# Altium schematic sheet Comunicaciones.SchDoc
size A4; SheetNumber: 2; SheetTotal: 3
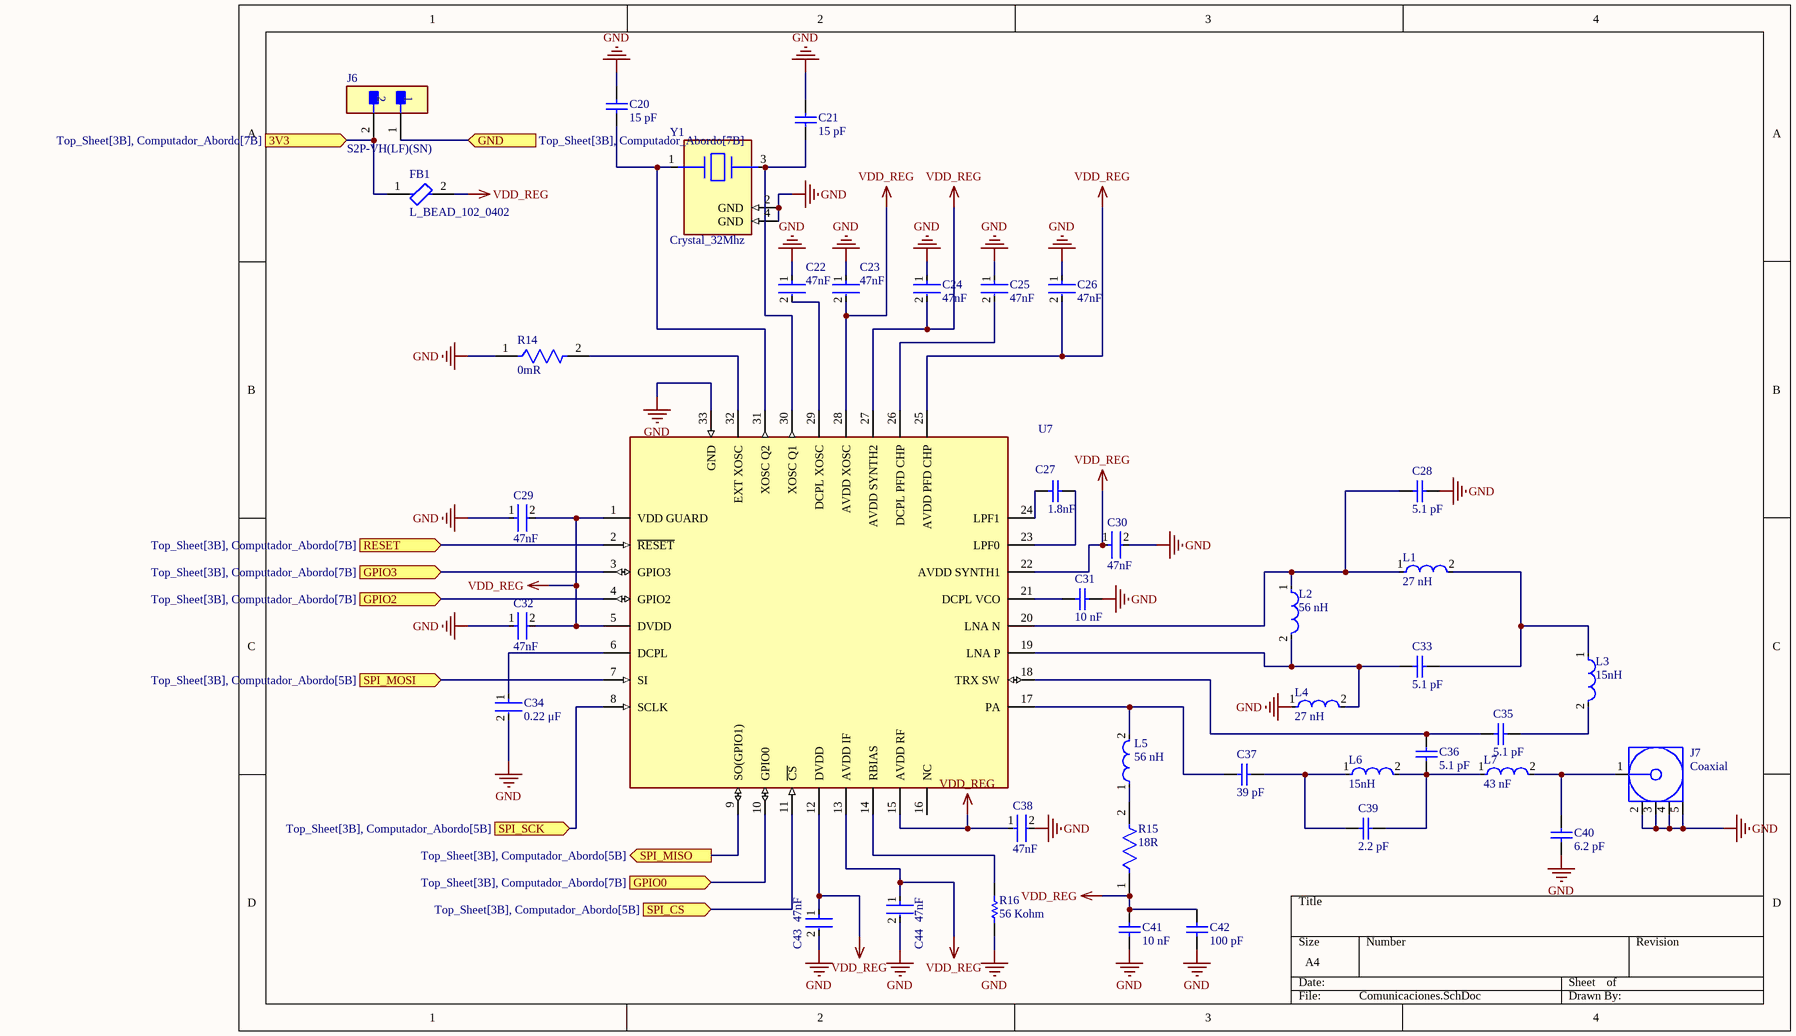
[diagram p0: Comunicaciones.SchDoc]

## Parts
C20  15 pF  [CAPC1005X55X25LL05T10]
C21  15 pF  [CAPC1005X55X25LL05T10]
C22  47nF  [FP-GRM155-0_05-IPC_A]
C23  47nF  [FP-GRM155-0_05-IPC_A]
C24  47nF  [FP-GRM155-0_05-IPC_A]
C25  47nF  [FP-GRM155-0_05-IPC_A]
C26  47nF  [FP-GRM155-0_05-IPC_A]
C27  1.8nF  [CAPC1005X55X25LL05T10]
C28  5.1 pF  [CAPC1005X55X25LL05T10]
C29  47nF  [FP-GRM155-0_05-IPC_A]
C30  47nF  [FP-GRM155-0_05-IPC_A]
C31  10 nF  [CAPC1005X55X25LL05T10]
C32  47nF  [FP-GRM155-0_05-IPC_A]
C33  5.1 pF  [CAPC1005X55X25LL05T10]
C34  0.22 μF  [FP-C0603C-CF-IPC_B]
C35  5.1 pF  [CAPC1005X55X25LL05T10]
C36  5.1 pF  [CAPC1005X55X25LL05T10]
C37  39 pF  [CAPC1005X55X25LL05T10]
C38  47nF  [FP-GRM155-0_05-IPC_A]
C39  2.2 pF  [CAPC1005X55X25LL05T10]
C40  6.2 pF  [CAPC1005X60X25ML10T15]
C41  10 nF  [CAPC1005X55X25LL05T10]
C42  100 pF  [CAPC1005X55X25LL05T10]
C43  47nF  [FP-GRM155-0_05-IPC_A]
C44  47nF  [FP-GRM155-0_05-IPC_A]
FB1  L_BEAD_102_0402  [FP-BLM15-0_05-IPC_C]
J6  S2P-VH(LF)(SN)  [FP-S2P-VH_LF_SN-MFG]
J7  Coaxial  [60312202114512]
L1  27 nH  [FP-LQW15AN_00-W0_5-0_1-MFG]
L2  56 nH  [FP-LQW15AN_00-W0_5-0_1-MFG]
L3  15nH  [FP-LQW15AN_00-W0_6-0_1-MFG]
L4  27 nH  [FP-LQW15AN_00-W0_5-0_1-MFG]
L5  56 nH  [FP-LQW15AN_00-W0_5-0_1-MFG]
L6  15nH  [FP-LQW15AN_00-W0_6-0_1-MFG]
L7  43 nF  [FP-LQW15AN_00-W0_5-0_1-MFG]
R14  0mR  [FP-RK73Z1E-IPC_B]
R15  18R  [FP-RMCF0402-IPC_B]
R16  56 Kohm  [RESC1005X40X25ML10T10]
U7  (no value)  [FP-RHB0032E-MFG]
Y1  Crystal_32Mhz  [FP-ABM10W-MFG]

## Ports
3V3 (in, see Top_Sheet[3B], Computador_Abordo[7B]), GND (in, see Top_Sheet[3B], Computador_Abordo[7B]), GPIO0 (in, see Top_Sheet[3B], Computador_Abordo[7B]), GPIO2 (in, see Top_Sheet[3B], Computador_Abordo[7B]), GPIO3 (in, see Top_Sheet[3B], Computador_Abordo[7B]), RESET (in, see Top_Sheet[3B], Computador_Abordo[7B]), SPI_CS (in, see Top_Sheet[3B], Computador_Abordo[5B]), SPI_MISO (out, see Top_Sheet[3B], Computador_Abordo[5B]), SPI_MOSI (in, see Top_Sheet[3B], Computador_Abordo[5B]), SPI_SCK (in, see Top_Sheet[3B], Computador_Abordo[5B])

## Nets
GND: C20.2 C21.2 C22.1 C23.1 C24.1 C25.1 C26.1 C28.1 C29.1 C30.2 C31.2 C32.1 C34.2 C38.2 C40.1 C41.1 C42.2 C43.2 C44.2 J7.2(GND) J7.3(GND) J7.4(GND) J7.5(GND) L4.1 R14.1 R16.1 U7.33(GND) Y1.2(GND) Y1.4(GND)
VDD_REG: C23.2 C24.2 C26.2 C29.2 C30.1 C32.2 C38.1 C41.2 C42.1 C43.1 C44.1 FB1.2 R15.1 U7.1(VDD_GUARD) U7.5(DVDD) U7.12(DVDD) U7.13(AVDD_IF) U7.15(AVDD_RF) U7.22(AVDD_SYNTH1) U7.25(AVDD_PFD_CHP) U7.27(AVDD_SYNTH2) U7.28(AVDD_XOSC)
3V3: FB1.1 J6.2 ; port 3V3
GND: J6.1 ; port GND  [a separate net that carries the same name]
GPIO0: U7.10(GPIO0) ; port GPIO0
GPIO2: U7.4(GPIO2) ; port GPIO2
GPIO3: U7.3(GPIO3) ; port GPIO3
RESET: U7.2(~{RESET}) ; port RESET
SPI_CS: U7.11(~{CS}) ; port SPI_CS
SPI_MISO: U7.9(SO(GPIO1)) ; port SPI_MISO
SPI_MOSI: U7.7(SI) ; port SPI_MOSI
SPI_SCK: U7.8(SCLK) ; port SPI_SCK
NetC20_1: C20.1 U7.31(XOSC_Q2) Y1.1
NetC21_1: C21.1 U7.30(XOSC_Q1) Y1.3
NetC22_2: C22.2 U7.29(DCPL_XOSC)
NetC25_2: C25.2 U7.26(DCPL_PFD_CHP)
NetC27_1: C27.1 U7.23(LPF0)
NetC27_2: C27.2 U7.24(LPF1)
NetC28_2: C28.2 L1.1 L2.1 U7.20(LNA_N)
NetC31_1: C31.1 U7.21(DCPL_VCO)
NetC33_1: C33.1 L1.2 L3.1
NetC33_2: C33.2 L2.2 L4.2 U7.19(LNA_P)
NetC34_1: C34.1 U7.6(DCPL)
NetC35_1: C35.1 L3.2
NetC35_2: C35.2 C36.1 U7.18(TRX_SW)
NetC36_2: C36.2 C39.2 L6.2 L7.1
NetC37_1: C37.1 L5.2 U7.17(PA)
NetC37_2: C37.2 C39.1 L6.1
NetC40_2: C40.2 J7.1(Signal) L7.2
NetL5_1: L5.1 R15.2
NetR14_2: R14.2 U7.32(EXT_XOSC)
NetR16_2: R16.2 U7.14(RBIAS)

Not connected (* = marked no-connect by the designer): U7 16(NC)

## Library data of the parts
C20 C21 = C_15P_0402_NP0_J_50: Part Number: GRM1555C1H150JZ01D; Manufacturer: Murata; Value: 15 pF
C22-C26 C29 C30 C32 C38 C43 C44 = C_47N_0402_X7R_K_25: Chip Multilayer Ceramic Capacitors for General Purpose, 0402, 47000pF, X7R, 15%, 10%, 25V; Depth: 0.5mm; Capacitance: 47nF; Case/Package: 0402; Tolerance: 10%; REACH SVHC: No SVHC; Termination: SMD/SMT; Number of Pins: 2; Mount: Surface Mount; Radiation Hardening: No; Height: 0.5mm; Min Operating Temperature: -55°C; Max Operating Temperature: 125°C; Thickness: 0.022inch; Length: 1mm; Voltage Rating (DC): 25V; Material: Ceramic; Lead Free: Lead Free; Packaging: Tape and Reel; Dielectric: X7R; Voltage: 25V; Case Code (Metric): 1005; Width: 0.02inch; Case Code (Imperial): 0402; Voltage Rating: 25V; Package Quantity: 1
C27 = C_1N8_0402_U2J_J_10: GRM1557U1A182JA01D; Manufacturer: Murata; Part Number: GRM1557U1A182JA01D; Value: 1.8nF
C28 C33 C35 C36 = C_5P1_0402_NP0_C_50: Part Number: GRM1555C1H5R1CZ01D; Manufacturer: Murata; Value: 5.1 pF
C31 C41 = C_10N_0402_X7R_K_25: Manufacturer: Murata; Part Number: GRM155R71E103KA01D; Value: 10 nF
C34 = C_220N_0402_X5R_K_10: C0603 0.22 μF X7R 30ppm/°C 10.00% 10 V; Manufacturer Part Number: C0603C224K8RAC; Manufacturer: KEMET; Automotive Grade: Grade 1; Material: Ceramic; Voltage Rating: 10 V; Tolerance: 0.1; Capacitance: 0.22 μF; Device Class L2: Capacitors; Temperature Range High: +125°C; RoHS: TRUE; Device Class L1: Passive Components; Temperature: -55°C to +125°C; Temperature Coefficient: 30ppm/°C; ComponentLink2Description: Datasheet; Device Class L3: Ceramic Capacitors; ComponentLink2URL: https://api.kemet.com/component-edge/download/datasheet/C0603C100J5GACAUTO.pdf; Value: 0.22 μF; Category: Cap; Lead Free: Yes; Automotive: Yes; Height: 0.87mm; Temperature Characteristic: X7R; Mouser Description: Multilayer Ceramic Capacitors MLCC - SMD/SMT 50volts 0.22 uF C0G X7R; Octopart: https://octopart.com/c0603c224k8rac-kemet-7455784; Package: C0603C-CF; Temperature Range Low: -55°C
C37 = C_39P_0402_NP0_J_50: Chip Capacitor, 39 pF, +/- 5%, 50 V, -55 to 125 degC, 0402 (1005 Metric), RoHS, Tape and Reel; PartNumber: GRM1555C1H390JZ01D; Voltage Rating (DC): 50 V; Type (Capacitors): C0G; Case\/Package: 0402; Length: 0.039 inch; RoHSCompliant: true; ComponentLink1URL: http://www.murata.com/; Packaging: Tape and Reel; Lead Pitch: 2 mm; PackageDescription: 2-Pin Surface Mount Device, Body 1 x 0.5 mm; PackageReference: 0402; Case Code (Metric): 1005; Pins: 2; Capacitance: 39 pF; Mounting Technology: Surface Mount; DatasheetVersion: 09/2016; REACH SVHC: No SVHC; Radiation Hardening: No; ComponentLink2Description: Datasheet; ComponentLink1Description: Manufacturer URL; Height: 0.5 mm; Package Quantity: 10000; Case Code (Imperial): 0402; Width: 0.02 inch; ComponentLink2URL: http://psearch.en.murata.com/capacitor/product/GRM1555C1H390JZ01_.pdf; Voltage Rating: 50 V; Max Operating Temperature: 125 degC; Min Operating Temperature: -55 degC; Mount: Surface Mount; Tolerance: 5%
C39 = C_2P2_0402_NP0_C_50: Manufacturer: Murata; Part Number: GRM1555C1H2R2CZ01D; Value: *
C40 = C_6P2_0402_NP0_C_50: Manufacturer: AVX Interconnect / Elco; Part Number: 04025A6R2CAT2A; Value: 6.2 pF
C42 = C_100P_0402_NP0_J_50: Part Number: GRM1555C1H101JZ01D; Manufacturer: Murata; Value: 100 pF
FB1 = L_BEAD_102_0402: Chip Ferrite Bead, 0402, 1000Ω @ 100MHz, 1.1Ω, 25%, 250mA; Number of Circuits: 1; DC Resistance-Max: 1.1R; Impedance: 1kR; Material: Steel; Shielding: Unshielded; Number of Pins: 2; REACH SVHC: No SVHC; Case/Package: 0402; Core Material: Ferrite; Packaging: Tape and Reel; Max DC Current: 250mA; Test Frequency: 100MHz; Case Code (Metric): 1005; Height: 0.5mm; Military Standard: Not; Max Operating Temperature: 125°C; Termination: SMD/SMT; Tolerance: 25%; Length: 1mm; Number of Lines: 1; Min Operating Temperature: -55°C; Depth: 0.5mm; Case Code (Imperial): 0402; DC Current: 250mA; Contact Plating: Tin; Series: BLM15H; Radiation Hardening: No; Width: 0.5mm; DC Resistance (DCR): 1.1R; Max Current Rating: 250mA; Current Rating: 250mA; Package Quantity: 1; Lead Free: Lead Free; Frequency: 100MHz
J6 = CMP-17439-000358-1: CONN HEADER R/A 2POS 3.96MM; Max Current Rating: 10A; Max Voltage Rating (AC): 250V; Contact Resistance: 20mR; Number of Positions: 2; Housing Color: White; Packaging: Box; Termination: Solder; Number of Rows: 1; Length: 7.86mm; Orientation: Right Angle; Pitch: 3.96mm; Min Operating Temperature: -25°C; Contact Plating: Copper; Max Operating Temperature: 85°C; Lead Free: Lead Free; Housing Material: Polyamide; Contact Material: Brass
J7 = SMA-10V21-TGG: Rf Coax Conn, Sma Jack, 50 Ohm, Pcb Rohs Compliant: Yes |Wurth Elektronik 60312202114512; Impedance: 50Ω; Insulation Resistance: 5GΩ; Insertion Loss (dB): 0.14dB; Min Operating Temperature: -65°C; Max Operating Temperature: 165°C; Orientation: Straight; Connector Type: SMA; Insulation Material: PTFE
L1 L4 = L_27N_0402_J_LQW: Wire Wound RF Inductor 27nH ±5% 280mA 0.52Ω 0402 (1005); Test Frequency: 100MHz; DC Resistance (DCR): 520mR; Q Factor: 25; Self Resonant Frequency: 3.5GHz; Core Material: Air; Shielding: Unshielded; Mount: Surface Mount; Package Quantity: 10000; Max Operating Temperature: 125°C; Termination: SMD/SMT; Weight: 2.8E-05oz; Case Code (Metric): 1005; Radiation Hardening: No; Case Code (Imperial): 0402; Military Standard: Not; Packaging: Tape and Reel; Tolerance: 5%; Lead Free: Lead Free; Depth: 0.6mm; DC Current: 280mA; Inductance: 27nH; Current Rating: 280mA; Min Operating Temperature: -55°C; Width: 0.02inch; Height: 0.5mm; Length: 1mm; Max DC Current: 280mA; Case/Package: 0402; Resistor Type: Wirewound; Value: 27 nH
L2 L5 = L_56N_0402_J_LQW: Wire Wound RF Inductor 56nH ±5% 200mA 1.17Ω 0402 (1005); Test Frequency: 100MHz; Shielding: Unshielded; Self Resonant Frequency: 2.8GHz; Core Material: Air; Q Factor: 25; DC Resistance (DCR): 1.17R; Termination: SMD/SMT; Case Code (Imperial): 0402; Resistor Type: Wirewound; Mount: Surface Mount; Tolerance: 5%; Lead Free: Lead Free; Height: 0.5mm; Packaging: Tape and Reel; Min Operating Temperature: -55°C; Max DC Current: 200mA; Case/Package: 0402; Package Quantity: 10000; Military Standard: Not; Current Rating: 200mA; DC Current: 200mA; Inductance: 56nH; Depth: 0.6mm; Radiation Hardening: No; Case Code (Metric): 1005; Max Operating Temperature: 125°C; Length: 1mm; Weight: 2.8E-05oz; Width: 0.5mm; =Value: 56 nH
L3 L6 = L_15N_0402_J_LQW: Wire Wound RF Inductor 15nH ±5% 460mA 0.16Ω 0402 (1005); Test Frequency: 100MHz; DC Resistance (DCR): 160mR; Shielding: Unshielded; Q Factor: 30; Core Material: Air; Self Resonant Frequency: 5GHz; Resistor Type: Wirewound; DC Current: 460mA; Inductance: 15nH; Weight: 2.8E-05oz; Radiation Hardening: No; Depth: 0.7mm; Package Quantity: 10000; Case/Package: 0402; Packaging: Tape and Reel; Length: 1mm; Max DC Current: 460mA; Case Code (Imperial): 0402; Tolerance: 5%; Min Operating Temperature: -55°C; Lead Free: Lead Free; Width: 0.02inch; Case Code (Metric): 1005; Termination: SMD/SMT; Military Standard: Not; Current Rating: 460mA; Height: 0.5mm; Mount: Surface Mount; Max Operating Temperature: 125°C
L7 = L_43N_0402_J_LQW: Wire Wound RF Inductor 43nH ±5% 250mA 0.7Ω 0402 (1005); Test Frequency: 100MHz; Current: 145mA; Core Material: Air; Self Resonant Frequency: 3GHz; DC Resistance (DCR): 700mR; Shielding: Unshielded; Q Factor: 25; REACH SVHC: No SVHC; Case/Package: 0402; Package Quantity: 1; Termination: SMD/SMT; Max Operating Temperature: 125°C; Case Code (Imperial): 0402; Height: 0.5mm; DC Current: 250mA; Inductance Tolerance: 5%; Length: 1mm; Tolerance: 5%; Max DC Current: 250mA; Min Operating Temperature: -55°C; Depth: 0.6mm; Radiation Hardening: No; Inductance: 43nH; Military Standard: Not; Packaging: Tape and Reel; Current Rating: 250mA; Case Code (Metric): 1005; Width: 0.02inch; Weight: 2.8E-05oz; Mount: Surface Mount; Value: 43 nF
R14 = R_0_0402: RES 0 OHM JUMPER 0402; Power Rating: 1W; Tolerance: 5%; Temperature Coefficient: 200ppm/°C; Max Operating Temperature: 155°C; Case Code (Imperial): 0402; RoHS Compliant: Yes; Case Code (Metric): 1005; Construction: Rectangular; Series: RK73Z; Military Standard: Not; Resistance: 0mR; Package Quantity: 10000; Lead Free: Lead Free; Packaging: Tape and Reel; Case/Package: 0402; Resistor Type: Thick Film; Min Operating Temperature: -55°C; Width: 0.5mm; Depth: 0.5mm; Termination: SMD/SMT; Height: 0.35mm; Length: 1mm
R15 = R_18_0402_J: 18Ω ±5% 0.063W 0402 Thick Film Chip Resistor AEC-Q200 compliant; Max Power Dissipation: 63mW; Temperature Coefficient: 100ppm/°C; Lead Free: Lead Free; Resistor Type: Thick Film; Packaging: Tape and Reel; Tolerance: 5%; Resistance: 18R; Contact Plating: Tin; Mount: Surface Mount; Min Operating Temperature: -55°C; Case/Package: 0402; Case Code (Metric): 1005; Number of Terminations: 2; Series: RMCF; Length: 0.039inch; Width: 0.02inch; Height: 0.016inch; RoHS Compliant: Yes; Features: Automotive AEC-Q200; Max Operating Temperature: 155°C; Case Code (Imperial): 0402
R16 = R_56K_0402_F: Part Number: RK73H1ETTP5602F; Manufacturer: KOA Speer; Value: 56 Kohm
U7 = CMP-04924-000017-1: IC RF TXRX+MCU ISM<1GHZ 32VFQFN; Min Supply Voltage: 2V; Max Frequency: 480MHz; Frequency: 960MHz; Sensitivity: -127dBm; Max Supply Voltage: 3.6V; Current - Receiving: 23mA; Number of Receivers: 1; Data Rate: 200Kbps; Current - Transmitting: 54mA; Interface: SPI; Min Frequency: 164MHz; Density: 0B; Output Power (dBm): 16dBm; RoHS Compliant: Yes; Package Quantity: 1; Lead Free: Lead Free; Number of Transmitters: 1; Max Operating Temperature: 85°C; REACH SVHC: No SVHC; Min Operating Temperature: -40°C; Radiation Hardening: No; Series: CC1120; Number of Pins: 32; Packaging: Tape and Reel; Case/Package: VQFN; Mount: Surface Mount
Y1 = Crystal_32Mhz: Crystal 32MHz ±10ppm 6pF SMD-4 2.5mm x 2mm